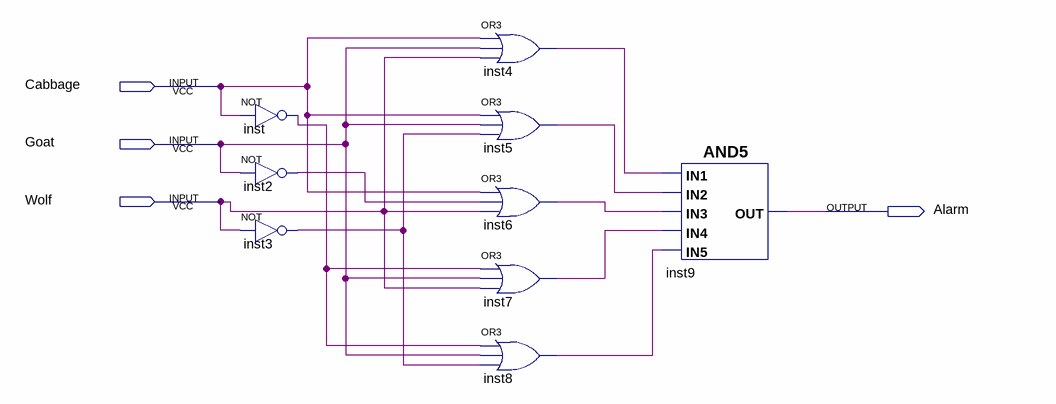
[diagram p0: schematic sheet]
// Quartus schematic lab3_0.bdf as structural Verilog: 9 symbols, 4 pins
module lab3_0 (
  input  Cabbage,
  input  Goat,
  input  Wolf,
  output Alarm
);

  wire inst2_out, inst3_out, inst4_out, inst5_out, inst6_out, inst7_out, inst8_out, inst_out;

  not inst (inst_out, Cabbage);
  not inst2 (inst2_out, Goat);
  not inst3 (inst3_out, Wolf);
  or inst4 (inst4_out, Cabbage, Goat, Wolf);
  or inst5 (inst5_out, Cabbage, Goat, inst3_out);
  or inst6 (inst6_out, Cabbage, inst2_out, Wolf);
  or inst7 (inst7_out, inst_out, Goat, Wolf);
  or inst8 (inst8_out, inst_out, Goat, inst3_out);
  and inst9 (Alarm, inst4_out, inst5_out, inst6_out, inst7_out, inst8_out);
endmodule
